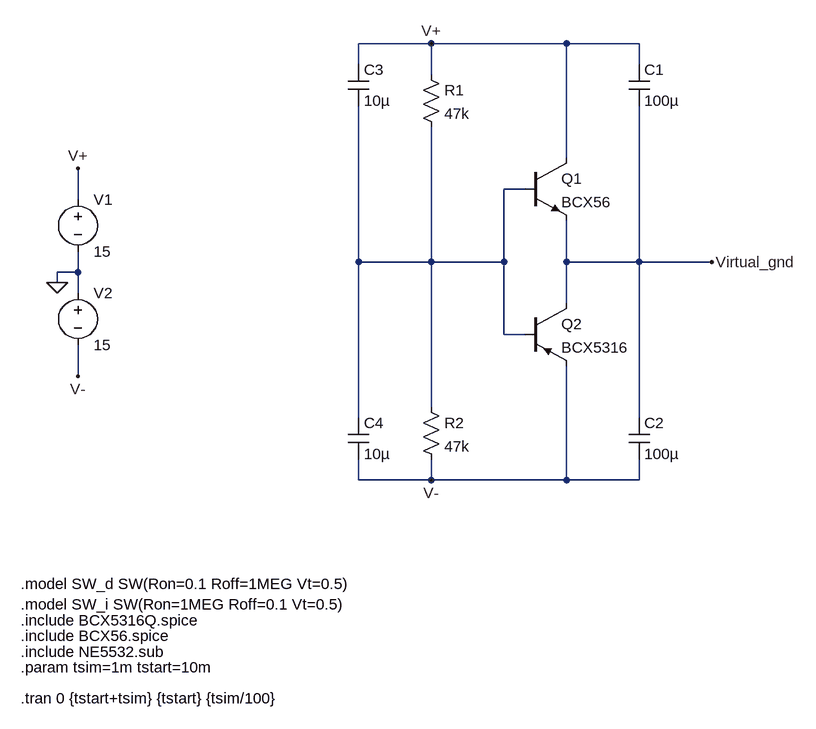
[diagram p0: schematic PowerSupplySplitter.asc]
PowerSupplySplitter.asc, the LTspice schematic file:
Version 4.1
SHEET 1 2868 2084
WIRE -288 -224 -400 -224
WIRE -80 -224 -288 -224
WIRE 32 -224 -80 -224
WIRE -400 -192 -400 -224
WIRE 32 -192 32 -224
WIRE -288 -176 -288 -224
WIRE -80 -48 -80 -224
WIRE -144 0 -176 0
WIRE -832 16 -832 -32
WIRE -400 112 -400 -128
WIRE -288 112 -288 -96
WIRE -288 112 -400 112
WIRE -176 112 -176 0
WIRE -176 112 -288 112
WIRE -80 112 -80 48
WIRE 32 112 32 -128
WIRE 32 112 -80 112
WIRE 144 112 32 112
WIRE -832 128 -832 96
WIRE -832 128 -864 128
WIRE -864 144 -864 128
WIRE -832 160 -832 128
WIRE -80 176 -80 112
WIRE -176 224 -176 112
WIRE -144 224 -176 224
WIRE -832 288 -832 240
WIRE -288 336 -288 112
WIRE -400 352 -400 112
WIRE 32 352 32 112
WIRE -400 448 -400 416
WIRE -288 448 -288 416
WIRE -288 448 -400 448
WIRE -80 448 -80 272
WIRE -80 448 -288 448
WIRE 32 448 32 416
WIRE 32 448 -80 448
FLAG -288 -224 V+
FLAG -288 448 V-
FLAG 144 112 Virtual_gnd
FLAG -864 144 0
FLAG -832 -32 V+
FLAG -832 288 V-
SYMBOL npn -144 -48 R0
SYMATTR InstName Q1
SYMATTR Value BCX56
SYMBOL res -304 -192 R0
SYMATTR InstName R1
SYMATTR Value 47k
SYMBOL res -304 320 R0
SYMATTR InstName R2
SYMATTR Value 47k
SYMBOL cap 16 -192 R0
SYMATTR InstName C1
SYMATTR Value 100µ
SYMBOL cap 16 416 M180
WINDOW 0 24 56 Left 2
WINDOW 3 24 8 Left 2
SYMATTR InstName C2
SYMATTR Value 100µ
SYMBOL cap -416 -192 R0
SYMATTR InstName C3
SYMATTR Value 10µ
SYMBOL cap -416 416 M180
WINDOW 0 24 56 Left 2
WINDOW 3 24 8 Left 2
SYMATTR InstName C4
SYMATTR Value 10µ
SYMBOL voltage -832 0 R0
SYMATTR InstName V1
SYMATTR Value 15
SYMBOL voltage -832 144 R0
SYMATTR InstName V2
SYMATTR Value 15
SYMBOL pnp -144 176 R0
SYMATTR InstName Q2
SYMATTR Value BCX5316
TEXT -920 736 Left 2 !.param tsim=1m tstart=10m
TEXT -920 712 Left 2 !.include NE5532.sub
TEXT -920 688 Left 2 !.include BCX56.spice
TEXT -920 664 Left 2 !.include BCX5316Q.spice
TEXT -920 784 Left 2 !.tran 0 {tstart+tsim} {tstart} {tsim/100}
TEXT -920 608 Left 2 !.model SW_d SW(Ron=0.1 Roff=1MEG Vt=0.5)\n.model SW_i SW(Ron=1MEG Roff=0.1 Vt=0.5)

The netlist it stands for:
* PowerSupplySplitter.asc
Q1 V+ N001 Virtual_gnd 0 BCX56
R1 V+ N001 47k
R2 N001 V- 47k
C1 V+ Virtual_gnd 100µ
C2 V- Virtual_gnd 100µ
C3 V+ N001 10µ
C4 V- N001 10µ
V1 V+ 0 15
V2 0 V- 15
Q2 Virtual_gnd N001 V- 0 BCX5316
.model NPN NPN
.model PNP PNP
.lib standard.bjt
.param tsim=1m tstart=10m
.include NE5532.sub
.include BCX56.spice
.include BCX5316Q.spice
.tran 0 {tstart+tsim} {tstart} {tsim/100}
.model SW_d SW(Ron=0.1 Roff=1MEG Vt=0.5)
.model SW_i SW(Ron=1MEG Roff=0.1 Vt=0.5)
.backanno
.end